# Altium schematic sheet POWER_PMIC_RK809_CODEC.SchDoc
size A4; SheetNumber: 8; SheetTotal: 27
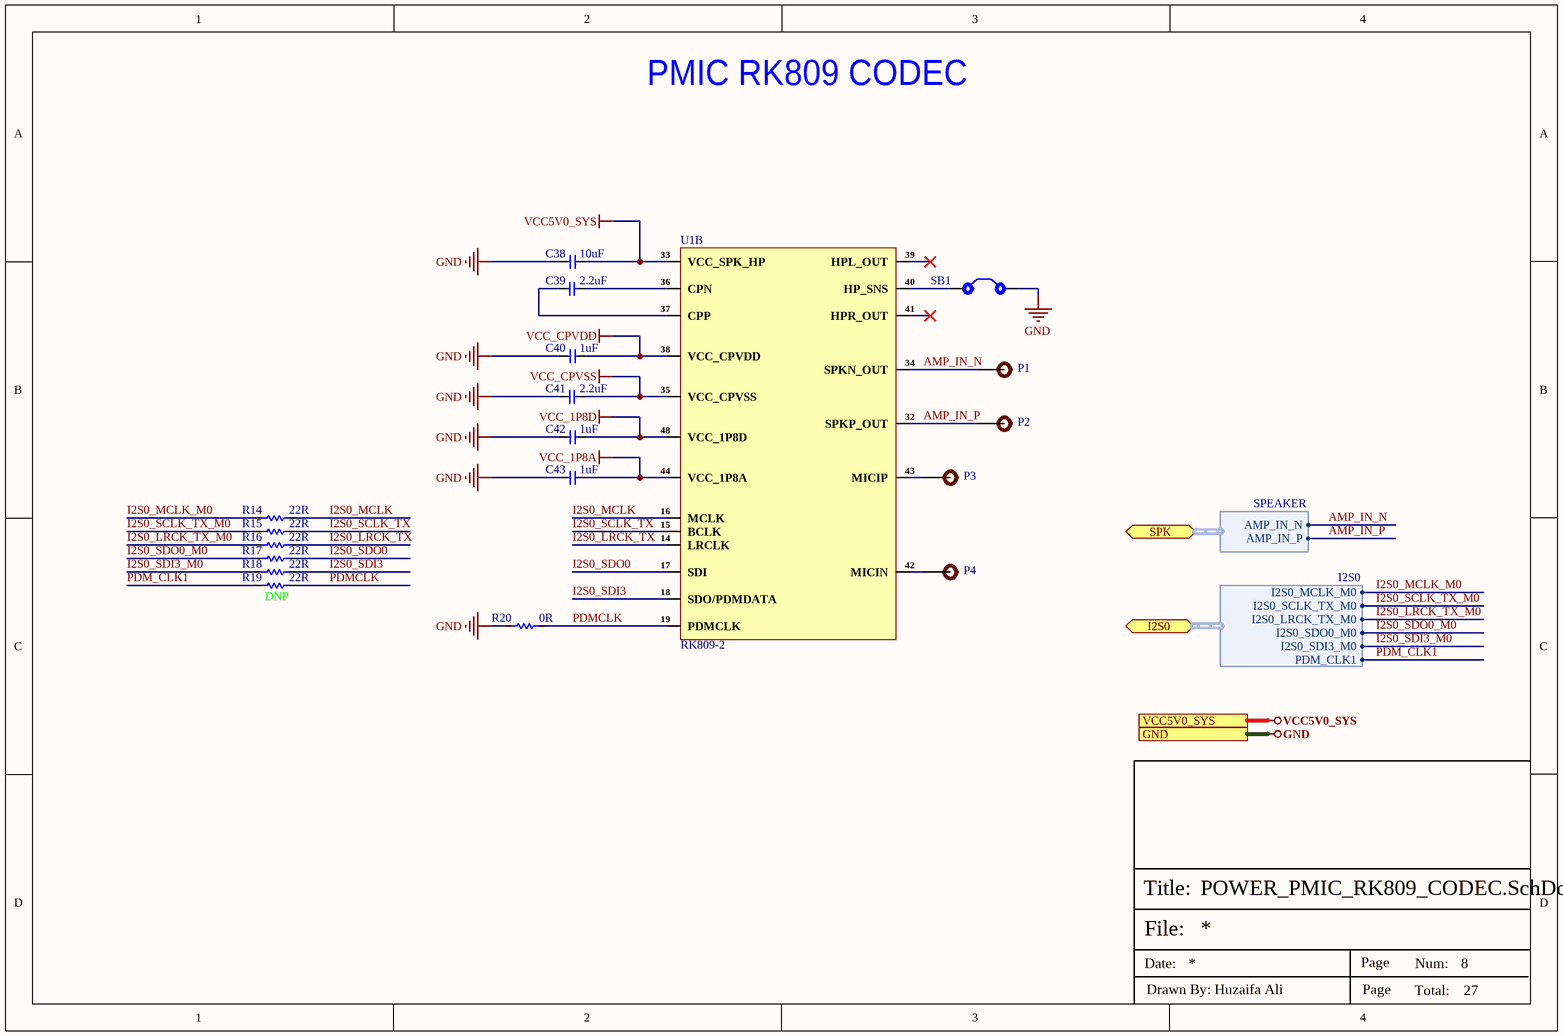
[diagram p0: POWER_PMIC_RK809_CODEC.SchDoc]

## Parts
C38  10uF  [Cap-0603]
C39  2.2uF  [Cap-0402]
C40  1uF  [Cap-0402]
C41  2.2uF  [Cap-0402]
C42  1uF  [Cap-0402]
C43  1uF  [Cap-0402]
P1  TEST POINT 0.5mm Dia  [Test-point - 0.5mm]  (value not drawn)  (no BOM)
P2  TEST POINT 0.5mm Dia  [Test-point - 0.5mm]  (value not drawn)  (no BOM)
P3  TEST POINT 0.5mm Dia  [Test-point - 0.5mm]  (value not drawn)  (no BOM)
P4  TEST POINT 0.5mm Dia  [Test-point - 0.5mm]  (value not drawn)  (no BOM)
R14  22R  [Res-0402]
R15  22R  [Res-0402]
R16  22R  [Res-0402]
R17  22R  [Res-0402]
R18  22R  [Res-0402]
R19  DNP  [Res-0402]
R20  0R  [Res-0402]
SB1  Solder Bridge 0402  [Solder Bridge 0402]  (value not drawn)  (no BOM)
U1  RK809-2  [68-QFN-(7x7)]  (part B of 4)

## Ports
GND (see BUCK_CONTROLLER_SHEET[3D], DDR3_SDRAM_SHEET[5D], DEBUG_UART_INTERFACE[3D], DIGITAL_MEMS_INTERFACE[3C], eMMC_INTERFACE[3D], ETH_PoE-PD_INTERFACE[4D], ETH_SWITCH_INTERFACE[5D], IR-CUT_LIGHT SENSOR_SHEET[3D], MIPI TO HDMI_MODULE[3D], MIPI-CSI_RXX_INTERFACE[3C], PoE_PSE_CONTROLLER[5D], POWER_LDO_SHEET[3D], POWER_PMIC_RK809_DC DC[3D], POWER_PMIC_RK809_LDO[4C], POWER_PMIC_RK809_MGM[3D], RV1126_AUDIO_SHEET[3D], RV1126_DRAM_SHEET[4C], RV1126_eMMC_SPI-FLASH[3C], RV1126_ETHERNET_SHEET[3D], RV1126_OSC-PLL-PMUIO[3C], RV1126_POWER_SHEET[1D], RV1126_SARADC_SHEET[3C], RV1126_SDMMC_SHEET[3C], SPEARKER_INTERFACE_SHEET[3C], SPI_FLASH_INTERFACE[3D], USB2.0_DEBUG_UART[3D]), I2S0 (bidir, harness I2S0, see RV1126_AUDIO_SHEET[2D]), SPK (bidir, harness SPEAKER, see SPEARKER_INTERFACE_SHEET[3C]), VCC5V0_SYS (see BUCK_CONTROLLER_SHEET[3D], IR-CUT_LIGHT SENSOR_SHEET[3D], MIPI TO HDMI_MODULE[3D], POWER_LDO_SHEET[3D], POWER_PMIC_RK809_DC DC[3D], POWER_PMIC_RK809_LDO[4C], POWER_PMIC_RK809_MGM[3D], RV1126_OSC-PLL-PMUIO[3C], USB2.0_DEBUG_UART[3D])

## Harnesses
I2S0: I2S0_MCLK_M0, I2S0_SCLK_TX_M0, I2S0_LRCK_TX_M0, I2S0_SDO0_M0, I2S0_SDI3_M0, PDM_CLK1
SPEAKER: AMP_IN_N, AMP_IN_P

## Nets
GND: C38.2 C40.2 C41.1 C42.2 C43.2 R20.1 SB1.2 ; port GND
VCC5V0_SYS: C38.1 U1.33(VCC_SPK_HP) ; port VCC5V0_SYS
VCC_1P8A: C43.1 U1.44(VCC_1P8A)
VCC_1P8D: C42.1 U1.48(VCC_1P8D)
VCC_CPVDD: C40.1 U1.38(VCC_CPVDD)
VCC_CPVSS: C41.2 U1.35(VCC_CPVSS)
AMP_IN_N: P1.1 U1.34(SPKN_OUT) ; port SPK.AMP_IN_N
AMP_IN_P: P2.1 U1.32(SPKP_OUT) ; port SPK.AMP_IN_P
I2S0_LRCK_TX: R16.2 U1.14(LRCLK)
I2S0_LRCK_TX_M0: R16.1 ; port I2S0.I2S0_LRCK_TX_M0
I2S0_MCLK: R14.2 U1.16(MCLK)
I2S0_MCLK_M0: R14.1 ; port I2S0.I2S0_MCLK_M0
I2S0_SCLK_TX: R15.2 U1.15(BCLK)
I2S0_SCLK_TX_M0: R15.1 ; port I2S0.I2S0_SCLK_TX_M0
I2S0_SDI3: R18.2 U1.18(SDO/PDMDATA)
I2S0_SDI3_M0: R18.1 ; port I2S0.I2S0_SDI3_M0
I2S0_SDO0: R17.2 U1.17(SDI)
I2S0_SDO0_M0: R17.1 ; port I2S0.I2S0_SDO0_M0
PDM_CLK1: R19.1 ; port I2S0.PDM_CLK1
PDMCLK: R19.2 R20.2 U1.19(PDMCLK)
NetC39_1: C39.1 U1.37(CPP)
NetC39_2: C39.2 U1.36(CPN)
NetP3_1: P3.1 U1.43(MICIP)
NetP4_1: P4.1 U1.42(MICIN)
NetSB1_1: SB1.1 U1.40(HP_SNS)

Not connected (* = marked no-connect by the designer): U1 39(HPL_OUT)* 41(HPR_OUT)*

## Notes on the sheet
- PMIC RK809 CODEC
- 22R
- File:
- Title:
- Date:
- Page
- Num:
- Total:
- Drawn By: Huzaifa Ali

## Library data of the parts
C38 = CC0603KRX5R6BB106: CAP CER 10UF 10V X5R 0603; Manufacturer: Yageo; Tolerance: 10%; Item Type: Capacitor; Supplier 1: Digi-Key; Manufacturer Part Number: CC0603KRX5R6BB106; RoHS: Yes; Category: Ceramic Capacitors; Stock 1: 187515; Pricing 1: 1=0.24000, 10=0.16300, 50=0.09780, 100=0.08260, 500=0.05654, 1000=0.05001 (USD); Mount: Surface Mount; Case/Package: 0603; Case Code (Metric): 1608; Case Code (Imperial): 0603; Weight: 7.1E-05oz; Min Operating Temperature: -55°C; Max Operating Temperature: 85°C; Capacitance: 10uF; Packaging: Tape and Reel; Dielectric: X5R; Voltage Rating: 10V; Termination: SMD/SMT; Resistor Type: Ceramic; Voltage Rating (DC): 10V; Package Quantity: 4000; Length: 0.063inch; Width: 0.031inch; Thickness: 0.035inch; Depth: 0.8mm; Lead Free: Lead Free; Halogen Free: Halogen Free; RoHS Compliant: Yes; ComponentLink1URL: http://www.mouser.com/ds/2/447/Yageo_UPY-GP_NP0_16V-to-50V_9-358835.pdf?src-supplier=Mouser; ComponentLink1Description: http://www.mouser.com/ds/2/447/Yageo_UPY-GP_NP0_16V-to-50V_9-358835.pdf?src-supplier=Mouser; ComponentLink2URL: http://www.yageo.com/documents/recent/UPY-GPHC_X5R_4V-to-50V_25.pdf?src-supplier=Digi-Key; ComponentLink2Description: http://www.yageo.com/documents/recent/UPY-GPHC_X5R_4V-to-50V_25.pdf?src-supplier=Digi-Key; Supplier Part Number 1: 311-1782-1-ND; LCSC Part Number: C326057
C39 C41 = C1005X5R0J225KTJA0E: CAP CER 2.2UF 6.3V X5R 0402; Manufacturer: TDK; Item Type: Capacitor; LCSC Part Number: C343036; Manufacturer Part Number: C1005X5R0J225KTJA0E; ComponentLink1Description: LCSC; ComponentLink1URL: https://www.lcsc.com/product-detail/Multilayer-Ceramic-Capacitors-MLCC-SMD-SMT_TDK-C1005X5R0J225KTJA0E_C343036.html
C40 C42 C43 = CC0402KRX5R6BB105: CAP CER 1UF 10V X5R 0402; Manufacturer: Yageo; Tolerance: 10%; Dissipation Factor: 15%; Item Type: Capacitor; Supplier 1: Mouser; Manufacturer Part Number: CC0402KRX5R6BB105; RoHS: Yes; Category: Ceramic Capacitors; Stock 1: 6711367; Pricing 1: 1=0.11000, 10=0.05500, 50=0.05500, 100=0.03300, 500=0.02700, 1000=0.02200, 2500=0.02100, 10000=0.01800 (USD); Mount: Surface Mount; Case/Package: 0402; Number of Pins: 2; Case Code (Metric): 1005; Case Code (Imperial): 0402; Min Operating Temperature: -55°C; Max Operating Temperature: 85°C; Capacitance: 1uF; Dielectric: X5R; Package Quantity: 1; Voltage Rating: 10V; Packaging: Tape and Reel; Voltage Rating (DC): 10V; Termination: SMD/SMT; Resistor Type: Ceramic; Series: CC; Construction: Flat; Length: 1mm; Width: 0.02inch; Height: 0.5mm; Thickness: 0.022inch; Depth: 0.5mm; Radiation Hardening: No; REACH SVHC: No SVHC; Lead Free: Lead Free; Halogen Free: Halogen Free; RoHS Compliant: Yes; ComponentLink1URL: https://datasheet.ciiva.com/176/upy-gphc-x5r-4v-to-50v-12-176704.pdf?src-supplier=Digi-Key; ComponentLink1Description: https://datasheet.ciiva.com/176/upy-gphc-x5r-4v-to-50v-12-176704.pdf?src-supplier=Digi-Key; ComponentLink2URL: https://datasheet.ciiva.com/176/mlccorderingcode-176705.pdf?src-supplier=Digi-Key; ComponentLink2Description: https://datasheet.ciiva.com/176/mlccorderingcode-176705.pdf?src-supplier=Digi-Key; ComponentLink3URL: https://datasheet.ciiva.com/176/mlccorderingcode-176706.pdf?src-supplier=Digi-Key; ComponentLink3Description: https://datasheet.ciiva.com/176/mlccorderingcode-176706.pdf?src-supplier=Digi-Key; Supplier Part Number 1: 603-CC402KRX5R6BB105; LCSC Part Number: C106254
P1-P4 = TEST POINT 0.5mm Dia: Test Point ON; Item Type: Test Point; Manufacturer Part Number: TEST POINT 0.5mm Dia
R14-R18 = RC0402FR-0722RL: RES 22 OHM 1% 1/16W 0402; Manufacturer: Yageo; Voltage Rating: 50V; Power Rating: 62.5mW; Temperature Coefficient: 100ppm/°C; Max Power Dissipation: 63mW; Item Type: Resistor; Supplier 1: Avnet; Manufacturer Part Number: RC0402FR-0722RL; RoHS: Yes; Category: Chip SMD Resistors; Stock 1: 1810000; Pricing 1: 10000=0.00085 (USD); Case/Package: 0402; Number of Pins: 2; Case Code (Imperial): 0402; Case Code (Metric): 1005; Size Code: 0402; Min Operating Temperature: -55°C; Max Operating Temperature: 155°C; Resistor Type: Thick Film; Voltage Rating (DC): 50V; Resistance: 22R; Tolerance: 1%; Packaging: Tape and Reel; Termination: SMD/SMT; Features: Moisture Resistant; Series: RC; Number of Terminations: 2; Resistance Tolerance: 1%; Technology: THICK FILM; Construction: Rectangular; Length: 1mm; Width: 0.5mm; Height: 0.32mm; Depth: 0.5mm; RoHS Compliant: Yes; Reach SVHC Compliant: Yes; Military Standard: Not; Lead Free: Lead Free; ComponentLink1URL: https://datasheet.ciiva.com/11819/0900766b80c66297-11819462.pdf?src-supplier=RSComponents; ComponentLink1Description: https://datasheet.ciiva.com/11819/0900766b80c66297-11819462.pdf?src-supplier=RSComponents; ComponentLink2URL: https://datasheet.ciiva.com/7849/1018594-7849912.pdf?src-supplier=Element14; ComponentLink2Description: https://datasheet.ciiva.com/7849/1018594-7849912.pdf?src-supplier=Element14; ComponentLink3URL: https://datasheet.ciiva.com/7849/1018594-7849911.pdf?src-supplier=Element14; ComponentLink3Description: https://datasheet.ciiva.com/7849/1018594-7849911.pdf?src-supplier=Element14; ComponentLink4URL: https://datasheet.ciiva.com/16930/pyu-rc0402-51-rohs-l-6-r-16930687.pdf?src-supplier=Future+Electronics; ComponentLink4Description: https://datasheet.ciiva.com/16930/pyu-rc0402-51-rohs-l-6-r-16930687.pdf?src-supplier=Future+Electronics; ComponentLink5URL: https://datasheet.ciiva.com/26829/getdatasheetpartid-554995-26829991.pdf?src-supplier=Verical; ComponentLink5Description: https://datasheet.ciiva.com/26829/getdatasheetpartid-554995-26829991.pdf?src-supplier=Verical; Supplier Part Number 1: RC0402FR-0722RL; LCSC Part Number: C114765
R19 = RC0402FR-0722RL: RES 22 OHM 1% 1/16W 0402; Manufacturer: Yageo; Voltage Rating: 50V; Resistance: 22R; Power Rating: 62.5mW; Temperature Coefficient: 100ppm/°C; Max Power Dissipation: 63mW; Item Type: Resistor; Supplier 1: Avnet; Manufacturer Part Number: RC0402FR-0722RL; RoHS: Yes; Category: Chip SMD Resistors; Stock 1: 1810000; Pricing 1: 10000=0.00085 (USD); Case/Package: 0402; Number of Pins: 2; Case Code (Imperial): 0402; Case Code (Metric): 1005; Size Code: 0402; Min Operating Temperature: -55°C; Max Operating Temperature: 155°C; Resistor Type: Thick Film; Voltage Rating (DC): 50V; Tolerance: 1%; Packaging: Tape and Reel; Termination: SMD/SMT; Features: Moisture Resistant; Series: RC; Number of Terminations: 2; Resistance Tolerance: 1%; Technology: THICK FILM; Construction: Rectangular; Length: 1mm; Width: 0.5mm; Height: 0.32mm; Depth: 0.5mm; RoHS Compliant: Yes; Reach SVHC Compliant: Yes; Military Standard: Not; Lead Free: Lead Free; ComponentLink1URL: https://datasheet.ciiva.com/11819/0900766b80c66297-11819462.pdf?src-supplier=RSComponents; ComponentLink1Description: https://datasheet.ciiva.com/11819/0900766b80c66297-11819462.pdf?src-supplier=RSComponents; ComponentLink2URL: https://datasheet.ciiva.com/7849/1018594-7849912.pdf?src-supplier=Element14; ComponentLink2Description: https://datasheet.ciiva.com/7849/1018594-7849912.pdf?src-supplier=Element14; ComponentLink3URL: https://datasheet.ciiva.com/7849/1018594-7849911.pdf?src-supplier=Element14; ComponentLink3Description: https://datasheet.ciiva.com/7849/1018594-7849911.pdf?src-supplier=Element14; ComponentLink4URL: https://datasheet.ciiva.com/16930/pyu-rc0402-51-rohs-l-6-r-16930687.pdf?src-supplier=Future+Electronics; ComponentLink4Description: https://datasheet.ciiva.com/16930/pyu-rc0402-51-rohs-l-6-r-16930687.pdf?src-supplier=Future+Electronics; ComponentLink5URL: https://datasheet.ciiva.com/26829/getdatasheetpartid-554995-26829991.pdf?src-supplier=Verical; ComponentLink5Description: https://datasheet.ciiva.com/26829/getdatasheetpartid-554995-26829991.pdf?src-supplier=Verical; Supplier Part Number 1: RC0402FR-0722RL; LCSC Part Number: C114765
R20 = RC0402FR-070RL: RES 0 OHM JUMPER 1/16W 0402; Manufacturer: Yageo; Item Type: Resistors; Tolerance: 1%; Power Rating: 62.5mW; Voltage Rating: 50V; Temperature Coefficient: 200ppm/°C; Max Power Dissipation: 63mW; Supplier 1: Mouser; Manufacturer Part Number: RC0402FR-070RL; RoHS: Yes; Stock 1: 8556842; Pricing 1: 1=0.10000, 10=0.01400, 50=0.01400, 100=0.00600, 1000=0.00300, 5000=0.00200, 10000=0.00100 (USD); Mount: Surface Mount; Case/Package: 0402; Contact Plating: Tin,Matte; Case Code (Imperial): 0402; Case Code (Metric): 1005; Size Code: 0402; Min Operating Temperature: -55°C; Max Operating Temperature: 155°C; Resistance: 0R; Resistor Type: Thick Film; Packaging: Tape and Reel; Termination: SMD/SMT; Features: Moisture Resistant; Series: RC; Number of Terminations: 2; Length: 1mm; Width: 0.5mm; Height: 0.35mm; Radiation Hardening: No; Lead Free: Lead Free; RoHS Compliant: Yes; ComponentLink1URL: https://datasheet.ciiva.com/8896/pyu-rc0402-51-rohs-l-6-8896149.pdf?src-supplier=Avnet; ComponentLink1Description: https://datasheet.ciiva.com/8896/pyu-rc0402-51-rohs-l-6-8896149.pdf?src-supplier=Avnet; ComponentLink2URL: https://datasheet.ciiva.com/16790/pyu-rc0402-51-rohs-l-6-r-16790444.pdf?src-supplier=Future+Electronics; ComponentLink2Description: https://datasheet.ciiva.com/16790/pyu-rc0402-51-rohs-l-6-r-16790444.pdf?src-supplier=Future+Electronics; Supplier Part Number 1: 603-RC0402FR-070RL; LCSC Part Number: C106231
SB1 = Solder Bridge 0402: Solder Bridge ON; Manufacturer Part Number: Solder Bridge 0402; Item Type: Solder Bridge
U1 = RK809-2: QFN-68-EP(7x7) Power Management Specialized - PMIC ROHS; Manufacturer: Rockchip; Item Type: IC; Manufacturer Part Number: RK809-2; Package: QFN-68-EP(7x7); LCSC Part Number: C2940552; ComponentLink1Description: LCSC; ComponentLink1URL: https://www.lcsc.com/product-detail/Power-Management-Specialized-PMIC_Rockchip-RK809-2_C2940552.html